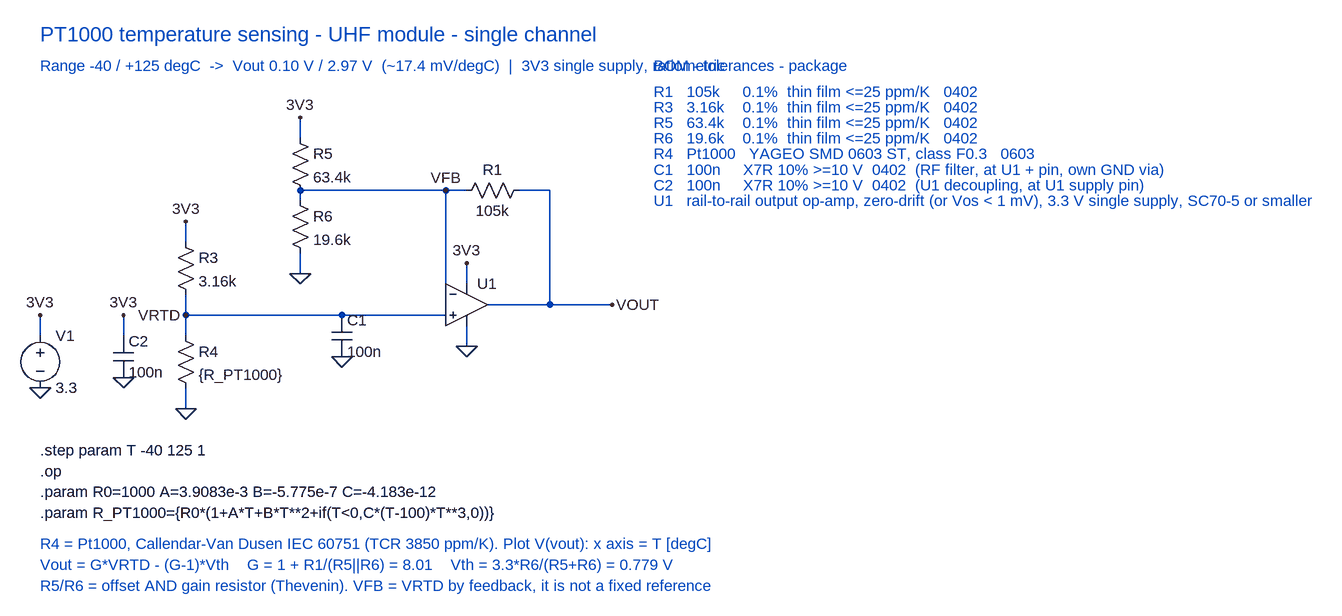
[diagram p0: schematic temp_sens_sim_7.asc]
temp_sens_sim_7.asc, the LTspice schematic file:
Version 4
SHEET 1 1600 800
WIRE -224 144 -224 176
WIRE 0 0 0 32
WIRE 0 112 0 144
WIRE 0 144 0 176
WIRE 0 256 0 288
WIRE 0 144 240 144
WIRE 240 144 400 144
WIRE -96 144 -96 176
WIRE 176 -160 176 -128
WIRE 176 -48 176 -32
WIRE 176 48 176 80
WIRE 176 -48 400 -48
WIRE 400 -48 400 112
WIRE 400 -48 432 -48
WIRE 512 -48 560 -48
WIRE 560 -48 560 128
WIRE 432 64 432 96
WIRE 432 160 432 192
WIRE 464 128 560 128
WIRE 560 128 656 128
FLAG -224 144 3V3
FLAG -224 256 0
FLAG 0 0 3V3
FLAG 0 288 0
FLAG 0 144 VRTD
FLAG 240 208 0
FLAG -96 144 3V3
FLAG -96 240 0
FLAG 176 -160 3V3
FLAG 176 80 0
FLAG 400 -48 VFB
FLAG 432 64 3V3
FLAG 432 192 0
FLAG 656 128 VOUT
SYMBOL voltage -224 160 R0
WINDOW 123 0 0 Left 0
WINDOW 39 0 0 Left 0
SYMATTR InstName V1
SYMATTR Value 3.3
SYMBOL cap -112 176 R0
SYMATTR InstName C2
SYMATTR Value 100n
SYMBOL cap 224 144 R0
SYMATTR InstName C1
SYMATTR Value 100n
SYMBOL res -16 16 R0
SYMATTR InstName R3
SYMATTR Value 3.16k
SYMBOL res -16 160 R0
SYMATTR InstName R4
SYMATTR Value {R_PT1000}
SYMBOL res 160 -144 R0
SYMATTR InstName R5
SYMATTR Value 63.4k
SYMBOL res 160 -48 R0
SYMATTR InstName R6
SYMATTR Value 19.6k
SYMBOL res 528 -64 R90
WINDOW 0 0 56 VBottom 2
WINDOW 3 32 56 VTop 2
SYMATTR InstName R1
SYMATTR Value 105k
SYMBOL OpAmps\\UniversalOpAmp 432 128 R0
SYMATTR InstName U1
TEXT -224 -288 Left 3 ;PT1000 temperature sensing - UHF module - single channel
TEXT -224 -240 Left 2 ;Range -40 / +125 degC  ->  Vout 0.10 V / 2.97 V  (~17.4 mV/degC)  |  3V3 single supply, ratiometric
TEXT -224 352 Left 2 !.step param T -40 125 1
TEXT -224 384 Left 2 !.op
TEXT -224 416 Left 2 !.param R0=1000 A=3.9083e-3 B=-5.775e-7 C=-4.183e-12
TEXT -224 448 Left 2 !.param R_PT1000={R0*(1+A*T+B*T**2+if(T<0,C*(T-100)*T**3,0))}
TEXT -224 496 Left 2 ;R4 = Pt1000, Callendar-Van Dusen IEC 60751 (TCR 3850 ppm/K). Plot V(vout): x axis = T [degC]
TEXT -224 528 Left 2 ;Vout = G*VRTD - (G-1)*Vth    G = 1 + R1/(R5||R6) = 8.01    Vth = 3.3*R6/(R5+R6) = 0.779 V
TEXT -224 560 Left 2 ;R5/R6 = offset AND gain resistor (Thevenin). VFB = VRTD by feedback, it is not a fixed reference
TEXT 720 -240 Left 2 ;BOM - tolerances - package
TEXT 720 -200 Left 2 ;R1   105k     0.1%  thin film <=25 ppm/K   0402
TEXT 720 -176 Left 2 ;R3   3.16k    0.1%  thin film <=25 ppm/K   0402
TEXT 720 -152 Left 2 ;R5   63.4k    0.1%  thin film <=25 ppm/K   0402
TEXT 720 -128 Left 2 ;R6   19.6k    0.1%  thin film <=25 ppm/K   0402
TEXT 720 -104 Left 2 ;R4   Pt1000   YAGEO SMD 0603 ST, class F0.3   0603
TEXT 720 -80 Left 2 ;C1   100n     X7R 10% >=10 V  0402  (RF filter, at U1 + pin, own GND via)
TEXT 720 -56 Left 2 ;C2   100n     X7R 10% >=10 V  0402  (U1 decoupling, at U1 supply pin)
TEXT 720 -32 Left 2 ;U1   rail-to-rail output op-amp, zero-drift (or Vos < 1 mV), 3.3 V single supply, SC70-5 or smaller

The netlist it stands for:
* temp_sens_sim_7.asc
V1 3V3 0 3.3
C2 3V3 0 100n
C1 VRTD 0 100n
R3 3V3 VRTD 3.16k
R4 VRTD 0 {R_PT1000}
R5 3V3 VFB 63.4k
R6 VFB 0 19.6k
R1 VOUT VFB 105k
XU1 VRTD VFB 3V3 0 VOUT level1 Avol=1Meg GBW=10Meg Vos=0 En=0 Enk=0 In=0 Ink=0 Rin=500Meg  ; pins In+ In- V+ V- OUT
* PT1000 temperature sensing - UHF module - single channel
* Range -40 / +125 degC  ->  Vout 0.10 V / 2.97 V  (~17.4 mV/degC)  |  3V3 single supply, ratiometric
.step param T -40 125 1
.op
.param R0=1000 A=3.9083e-3 B=-5.775e-7 C=-4.183e-12
.param R_PT1000={R0*(1+A*T+B*T**2+if(T<0,C*(T-100)*T**3,0))}
* R4 = Pt1000, Callendar-Van Dusen IEC 60751 (TCR 3850 ppm/K). Plot V(vout): x axis = T [degC]
* Vout = G*VRTD - (G-1)*Vth    G = 1 + R1/(R5||R6) = 8.01    Vth = 3.3*R6/(R5+R6) = 0.779 V
* R5/R6 = offset AND gain resistor (Thevenin). VFB = VRTD by feedback, it is not a fixed reference
* BOM - tolerances - package
* R1   105k     0.1%  thin film <=25 ppm/K   0402
* R3   3.16k    0.1%  thin film <=25 ppm/K   0402
* R5   63.4k    0.1%  thin film <=25 ppm/K   0402
* R6   19.6k    0.1%  thin film <=25 ppm/K   0402
* R4   Pt1000   YAGEO SMD 0603 ST, class F0.3   0603
* C1   100n     X7R 10% >=10 V  0402  (RF filter, at U1 + pin, own GND via)
* C2   100n     X7R 10% >=10 V  0402  (U1 decoupling, at U1 supply pin)
* U1   rail-to-rail output op-amp, zero-drift (or Vos < 1 mV), 3.3 V single supply, SC70-5 or smaller
.lib UniversalOpAmp1.lib
.backanno
.end

* Results of the author's LTspice run, read from the files saved beside the schematic
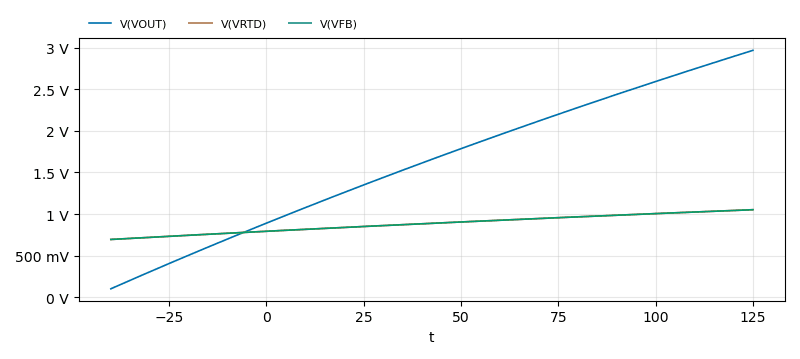
[diagram p1: Operating Point of temp_sens_sim_7.asc, plotted from the saved traces]
* Operating Point, 1 run:
*   V(VOUT): 101.8 mV at t=-40 , 2.967 V at t=125 , min 101.8 mV, max 2.967 V
*   V(VRTD): 694.8 mV at t=-40 , 1.052 V at t=125 , min 694.8 mV, max 1.052 V
*   V(VFB): 694.8 mV at t=-40 , 1.052 V at t=125 , min 694.8 mV, max 1.052 V